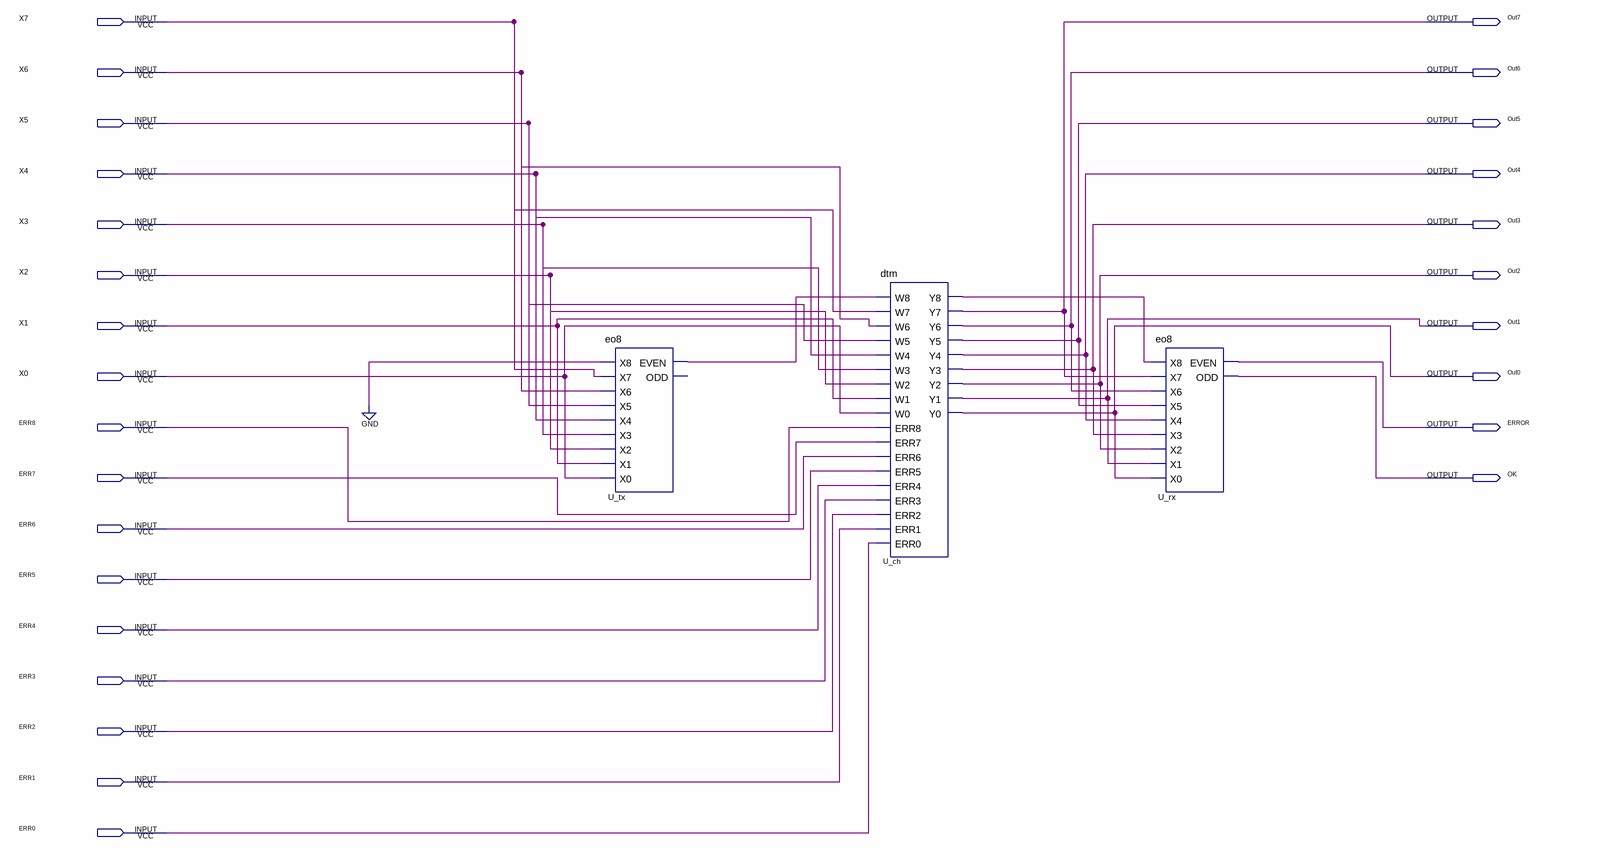
[diagram p0: schematic sheet]
// Quartus schematic link.bdf as structural Verilog: 3 symbols, 27 pins
module link (
  input  X7,
  input  X6,
  input  X5,
  input  X4,
  input  X3,
  input  X2,
  input  X1,
  input  X0,
  input  ERR8,
  input  ERR7,
  input  ERR6,
  input  ERR5,
  input  ERR4,
  input  ERR3,
  input  ERR2,
  input  ERR1,
  input  ERR0,
  output Out7,
  output Out6,
  output Out5,
  output Out4,
  output Out3,
  output Out2,
  output Out1,
  output Out0,
  output ERROR,
  output OK
);

  wire U_ch_y8, U_tx_even;

  eo8 U_tx (
    .X8(1'b0), .X7(X7), .X6(X6), .X5(X5), .X4(X4), .X3(X3), .X2(X2), .X1(X1), .X0(X0), .EVEN(U_tx_even));  // open: ODD
  dtm U_ch (
    .W8(U_tx_even), .W7(X7), .W6(X6), .W5(X5), .W4(X4), .W3(X3), .W2(X2), .W1(X1), .W0(X0), .ERR8(ERR8),
    .ERR7(ERR7), .ERR6(ERR6), .ERR5(ERR5), .ERR4(ERR4), .ERR3(ERR3), .ERR2(ERR2), .ERR1(ERR1), .ERR0(ERR0),
    .Y8(U_ch_y8), .Y7(Out7), .Y6(Out6), .Y5(Out5), .Y4(Out4), .Y3(Out3), .Y2(Out2), .Y1(Out1), .Y0(Out0));
  eo8 U_rx (
    .X8(U_ch_y8), .X7(Out7), .X6(Out6), .X5(Out5), .X4(Out4), .X3(Out3), .X2(Out2), .X1(Out1), .X0(Out0),
    .EVEN(ERROR), .ODD(OK));
endmodule
